# Altium schematic sheet Main Scheme.SchDoc: ИЛ1428ТО1/1
size 410 x 297 mm; ApprovedBy: Стерхов В.Д.; CheckedBy: Стерхов В.Д.; Author: Сергеев Д.А.; CompanyName: ГК "СНАБЖЕНИЕ"; DrawnBy: Сергеев Д.А.; Engineer: Сергеев Д.А.; Organization: ГК "СНАБЖЕНИЕ"; DocumentNumber: ИЛ1428ТО1/1; Revision: 1; SheetNumber: 1; SheetTotal: 5
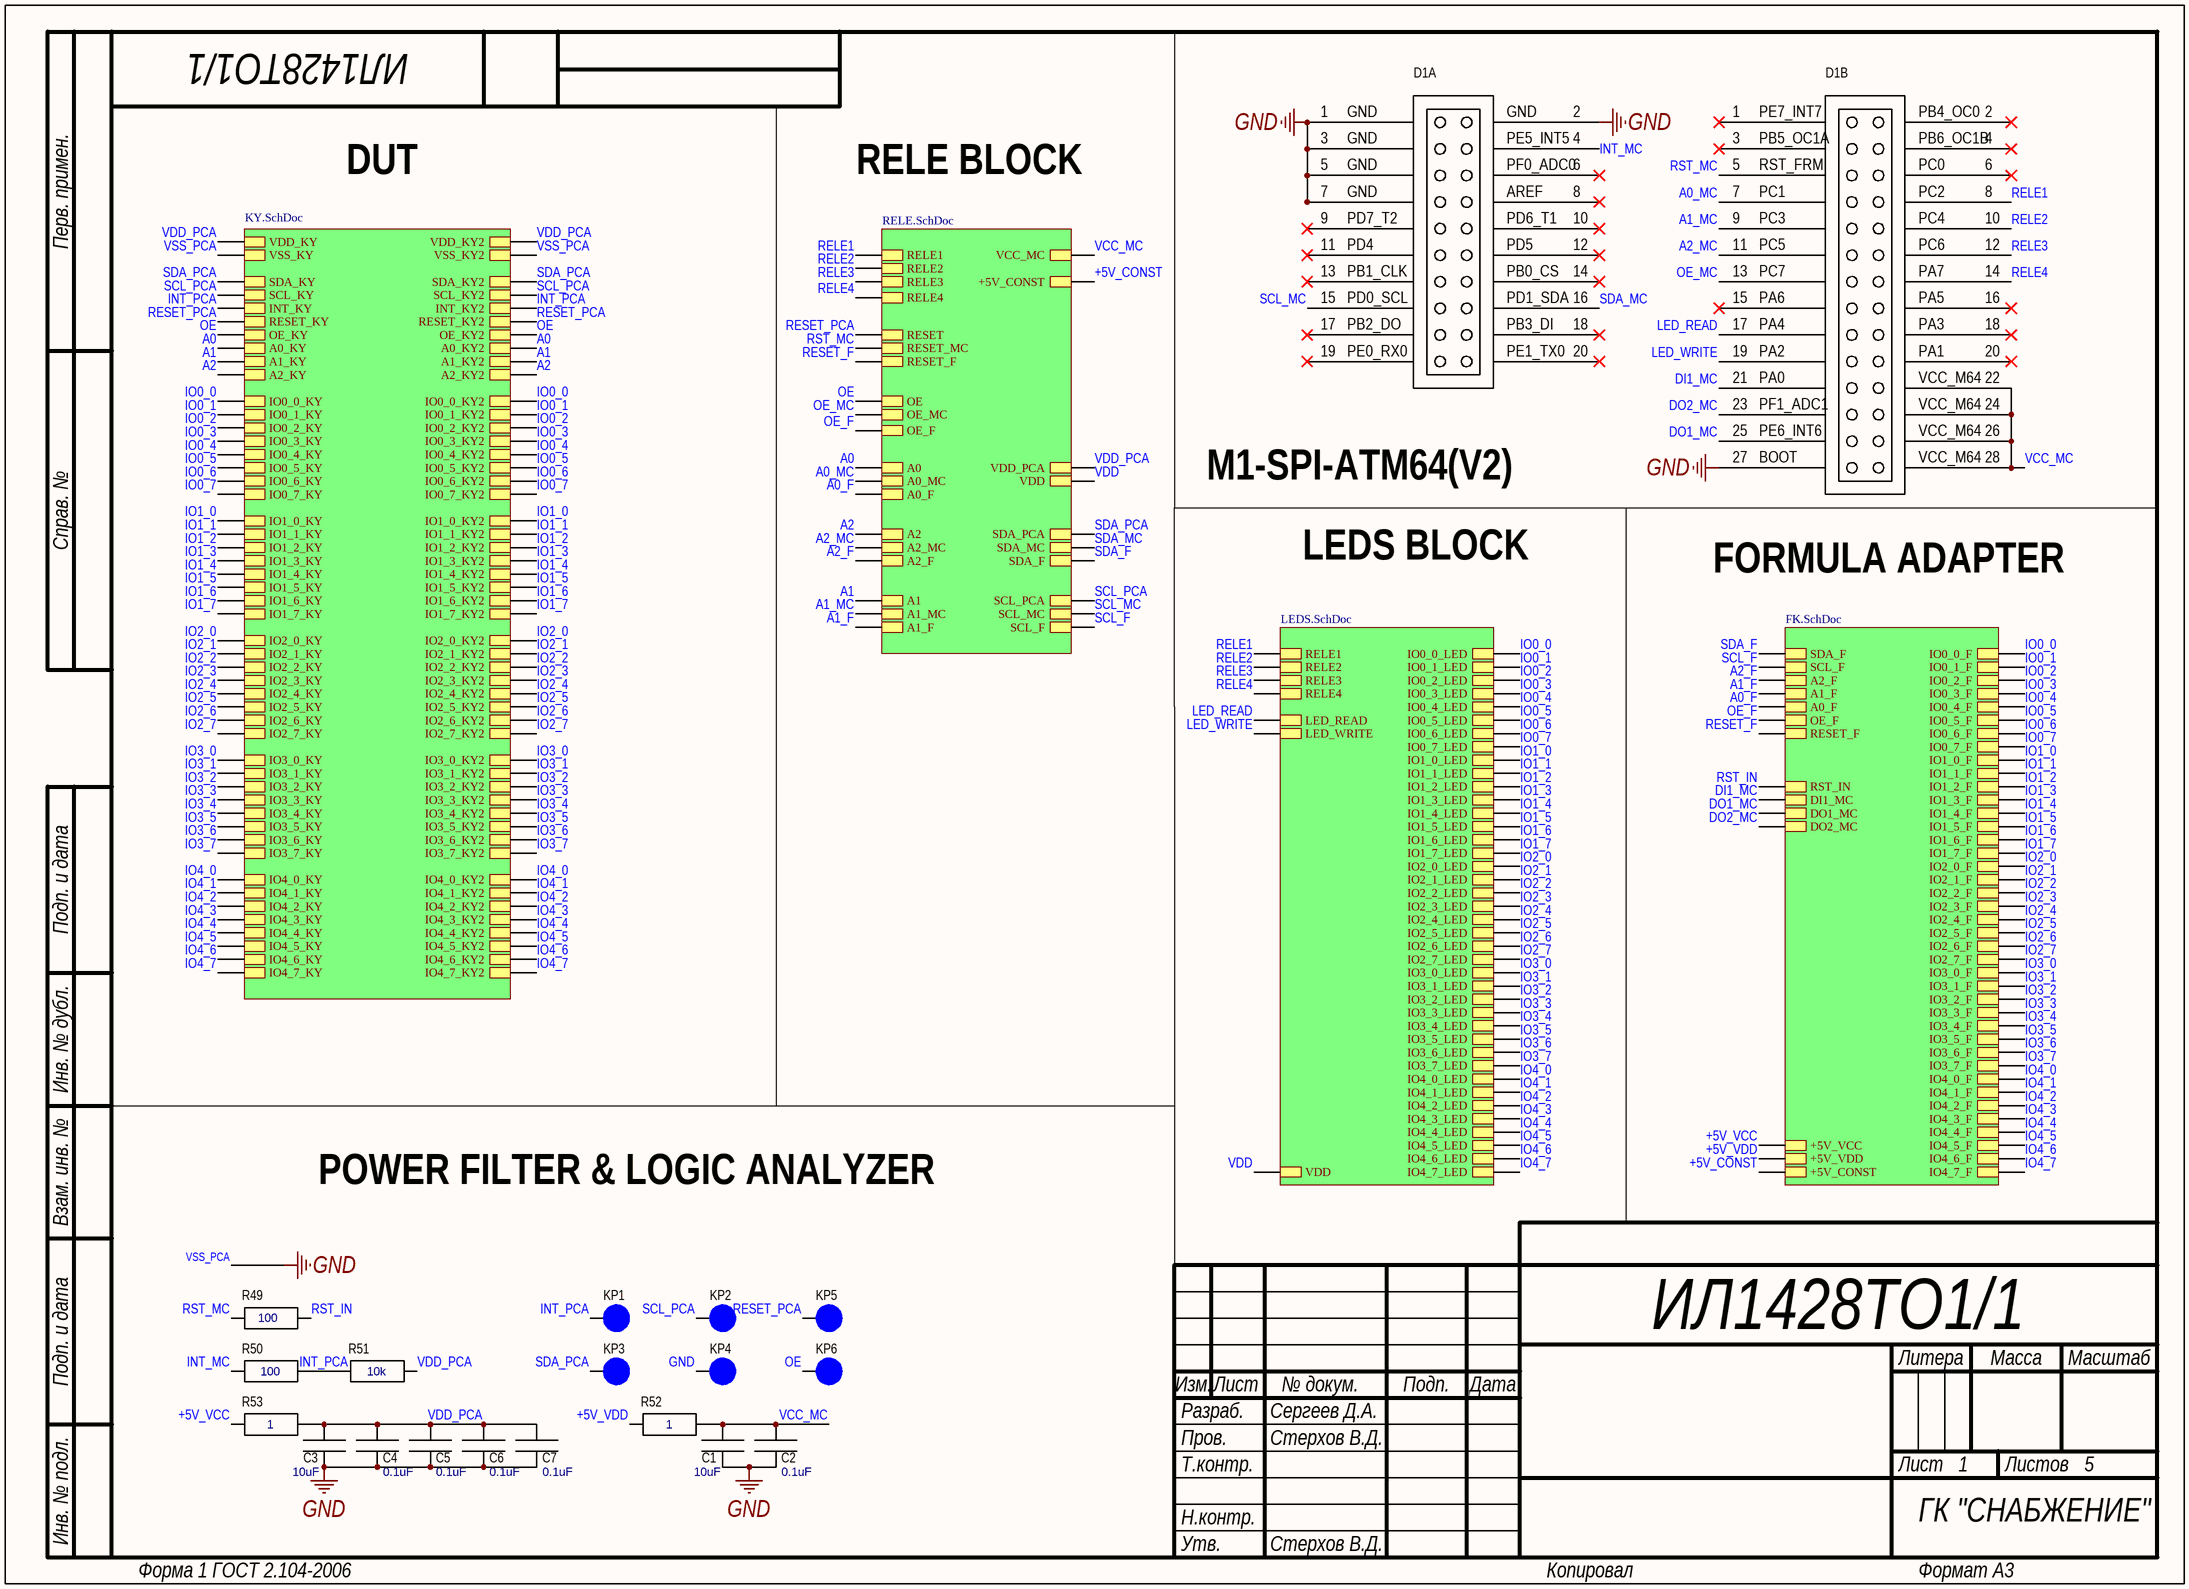
[diagram p0: Main Scheme.SchDoc]

## Parts
C1  10uF  [0805]
C2  0.1uF  [0805]
C3  10uF  [0805]
C4  0.1uF  [0805]
C5  0.1uF  [0805]
C6  0.1uF  [0805]
C7  0.1uF  [0805]
D1  M1-SPI-ATM64(V2)  [M1-SPI-ATM64(V2)]  (value not drawn)  (parts A,B of 2)
KP1  Contact  [Contact]  (value not drawn)
KP2  Contact  [Contact]  (value not drawn)
KP3  Contact  [Contact]  (value not drawn)
KP4  Contact  [Contact]  (value not drawn)
KP5  Contact  [Contact]  (value not drawn)
KP6  Contact  [Contact]  (value not drawn)
R49  100  [0805]
R50  100  [0805]
R51  10k  [0805]
R52  1  [0805]
R53  1  [0805]

## Sub-sheets
FK = FK.SchDoc: +5V_VCC, +5V_VDD, +5V_CONST, RESET_F, OE_F, A0_F, A1_F, A2_F, SDA_F, SCL_F, IO0_0_F, IO0_1_F, IO0_2_F, IO0_3_F, IO0_4_F, IO0_5_F, IO0_6_F, IO0_7_F, IO1_0_F, IO1_1_F, IO1_2_F, IO1_3_F, IO1_4_F, IO1_5_F, IO1_6_F, IO1_7_F, IO2_0_F, IO2_1_F, IO2_2_F, IO2_3_F, IO2_4_F, IO2_5_F, IO2_6_F, IO2_7_F, IO3_0_F, IO3_1_F, IO3_2_F, IO3_3_F, IO3_4_F, IO3_5_F, IO3_6_F, IO3_7_F, IO4_0_F, IO4_1_F, IO4_2_F, IO4_3_F, IO4_4_F, IO4_5_F, IO4_6_F, IO4_7_F, DI1_MC, DO1_MC, DO2_MC, RST_IN
LEDS = LEDS.SchDoc: VDD, IO0_0_LED, IO0_1_LED, IO0_2_LED, IO0_3_LED, IO0_4_LED, IO0_5_LED, IO0_6_LED, IO0_7_LED, IO1_0_LED, IO1_1_LED, IO1_2_LED, IO1_3_LED, IO1_4_LED, IO1_5_LED, IO1_6_LED, IO1_7_LED, IO2_0_LED, IO2_1_LED, IO2_2_LED, IO2_3_LED, IO2_4_LED, IO2_5_LED, IO2_6_LED, IO2_7_LED, IO3_0_LED, IO3_1_LED, IO3_2_LED, IO3_3_LED, IO3_4_LED, IO3_5_LED, IO3_6_LED, IO3_7_LED, IO4_0_LED, IO4_1_LED, IO4_2_LED, IO4_3_LED, IO4_4_LED, IO4_5_LED, IO4_6_LED, IO4_7_LED, RELE1, RELE2, LED_WRITE, LED_READ, RELE3, RELE4
RELE = RELE.SchDoc: +5V_CONST, SCL_PCA, SDA_PCA, SDA_MC, SCL_MC, VCC_MC, RELE1, SDA_F, SCL_F, VDD_PCA, VDD, RESET, RESET_MC, RESET_F, RELE2, A0, A0_MC, A0_F, A1, A1_MC, A1_F, RELE3, A2, A2_MC, A2_F, OE, OE_MC, OE_F, RELE4
UCP_s21 = KY.SchDoc: IO1_1_KY2, IO1_4_KY2, IO4_1_KY2, IO4_7_KY2, VDD_KY, IO4_0_KY2, IO4_4_KY2, IO4_3_KY2, VSS_KY, IO4_5_KY2, IO3_7_KY2, IO3_6_KY2, IO2_1_KY2, SCL_KY2, IO2_6_KY2, IO2_0_KY2, OE_KY2, A2_KY2, VDD_KY2, IO2_2_KY2, IO2_4_KY2, IO1_3_KY2, IO1_2_KY2, IO3_5_KY2, IO2_3_KY2, A0_KY2, IO1_7_KY2, A1_KY2, SDA_KY2, IO3_1_KY2, IO2_5_KY2, IO2_7_KY2, IO3_0_KY2, VSS_KY2, IO1_0_KY2, IO3_3_KY2, RESET_KY2, INT_KY2, IO4_2_KY2, IO4_6_KY2, IO1_6_KY2, IO3_4_KY2, INT_KY, IO1_5_KY2, IO3_2_KY2, IO0_7_KY2, IO0_5_KY2, IO0_6_KY2, SCL_KY, IO0_7_KY, IO1_3_KY, IO0_3_KY2, IO0_4_KY2, IO3_2_KY, RESET_KY, OE_KY, IO1_7_KY, IO0_3_KY, IO2_5_KY, IO3_4_KY, IO1_0_KY, IO0_6_KY, IO0_2_KY, IO2_7_KY, IO2_0_KY, IO3_1_KY, IO4_3_KY, IO0_4_KY, IO0_5_KY, IO3_7_KY, IO3_3_KY, IO3_6_KY, IO1_4_KY, IO1_5_KY, IO4_6_KY, IO4_1_KY, IO0_0_KY2, IO2_2_KY, IO0_1_KY, IO3_0_KY, IO2_1_KY, IO3_5_KY, IO1_1_KY, IO4_4_KY, IO4_2_KY, A0_KY, A1_KY, IO1_2_KY, IO2_3_KY, IO0_2_KY2, A2_KY, IO2_4_KY, IO4_7_KY, IO0_1_KY2, IO1_6_KY, SDA_KY, IO4_5_KY, IO2_6_KY, IO0_0_KY, IO4_0_KY

## Nets
GND: C1.2 C2.2 C3.2 C4.2 C5.2 C6.2 C7.2 D1.1X2 D1.2X2 D1.3X2 D1.5X2 D1.7X2 D1.27X3 KP4.1 ; sheet UCP_s21/VSS_KY, sheet UCP_s21/VSS_KY2  [also labelled VSS_PCA]
+5V_CONST: sheet FK/+5V_CONST, sheet RELE/+5V_CONST
+5V_VCC: R53.1 ; sheet FK/+5V_VCC
+5V_VDD: R52.1 ; sheet FK/+5V_VDD
A0: sheet RELE/A0, sheet UCP_s21/A0_KY2, sheet UCP_s21/A0_KY
A0_F: sheet FK/A0_F, sheet RELE/A0_F
A0_MC: D1.7X3 ; sheet RELE/A0_MC
A1: sheet RELE/A1, sheet UCP_s21/A1_KY2, sheet UCP_s21/A1_KY
A1_F: sheet FK/A1_F, sheet RELE/A1_F
A1_MC: D1.9X3 ; sheet RELE/A1_MC
A2: sheet RELE/A2, sheet UCP_s21/A2_KY2, sheet UCP_s21/A2_KY
A2_F: sheet FK/A2_F, sheet RELE/A2_F
A2_MC: D1.11X3 ; sheet RELE/A2_MC
DI1_MC: D1.21X3 ; sheet FK/DI1_MC
DO1_MC: D1.25X3 ; sheet FK/DO1_MC
DO2_MC: D1.23X3 ; sheet FK/DO2_MC
INT_MC: D1.4X2 R50.1
INT_PCA: KP1.1 R50.2 R51.1 ; sheet UCP_s21/INT_KY2, sheet UCP_s21/INT_KY
IO0_0: sheet LEDS/IO0_0_LED, sheet FK/IO0_0_F, sheet UCP_s21/IO0_0_KY2, sheet UCP_s21/IO0_0_KY
IO0_1: sheet LEDS/IO0_1_LED, sheet FK/IO0_1_F, sheet UCP_s21/IO0_1_KY, sheet UCP_s21/IO0_1_KY2
IO0_2: sheet LEDS/IO0_2_LED, sheet FK/IO0_2_F, sheet UCP_s21/IO0_2_KY, sheet UCP_s21/IO0_2_KY2
IO0_3: sheet LEDS/IO0_3_LED, sheet FK/IO0_3_F, sheet UCP_s21/IO0_3_KY2, sheet UCP_s21/IO0_3_KY
IO0_4: sheet LEDS/IO0_4_LED, sheet FK/IO0_4_F, sheet UCP_s21/IO0_4_KY2, sheet UCP_s21/IO0_4_KY
IO0_5: sheet LEDS/IO0_5_LED, sheet FK/IO0_5_F, sheet UCP_s21/IO0_5_KY2, sheet UCP_s21/IO0_5_KY
IO0_6: sheet LEDS/IO0_6_LED, sheet FK/IO0_6_F, sheet UCP_s21/IO0_6_KY2, sheet UCP_s21/IO0_6_KY
IO0_7: sheet LEDS/IO0_7_LED, sheet FK/IO0_7_F, sheet UCP_s21/IO0_7_KY2, sheet UCP_s21/IO0_7_KY
IO1_0: sheet LEDS/IO1_0_LED, sheet FK/IO1_0_F, sheet UCP_s21/IO1_0_KY2, sheet UCP_s21/IO1_0_KY
IO1_1: sheet LEDS/IO1_1_LED, sheet FK/IO1_1_F, sheet UCP_s21/IO1_1_KY2, sheet UCP_s21/IO1_1_KY
IO1_2: sheet LEDS/IO1_2_LED, sheet FK/IO1_2_F, sheet UCP_s21/IO1_2_KY2, sheet UCP_s21/IO1_2_KY
IO1_3: sheet LEDS/IO1_3_LED, sheet FK/IO1_3_F, sheet UCP_s21/IO1_3_KY2, sheet UCP_s21/IO1_3_KY
IO1_4: sheet LEDS/IO1_4_LED, sheet FK/IO1_4_F, sheet UCP_s21/IO1_4_KY2, sheet UCP_s21/IO1_4_KY
IO1_5: sheet LEDS/IO1_5_LED, sheet FK/IO1_5_F, sheet UCP_s21/IO1_5_KY2, sheet UCP_s21/IO1_5_KY
IO1_6: sheet LEDS/IO1_6_LED, sheet FK/IO1_6_F, sheet UCP_s21/IO1_6_KY2, sheet UCP_s21/IO1_6_KY
IO1_7: sheet LEDS/IO1_7_LED, sheet FK/IO1_7_F, sheet UCP_s21/IO1_7_KY2, sheet UCP_s21/IO1_7_KY
IO2_0: sheet LEDS/IO2_0_LED, sheet FK/IO2_0_F, sheet UCP_s21/IO2_0_KY2, sheet UCP_s21/IO2_0_KY
IO2_1: sheet LEDS/IO2_1_LED, sheet FK/IO2_1_F, sheet UCP_s21/IO2_1_KY2, sheet UCP_s21/IO2_1_KY
IO2_2: sheet LEDS/IO2_2_LED, sheet FK/IO2_2_F, sheet UCP_s21/IO2_2_KY2, sheet UCP_s21/IO2_2_KY
IO2_3: sheet LEDS/IO2_3_LED, sheet FK/IO2_3_F, sheet UCP_s21/IO2_3_KY2, sheet UCP_s21/IO2_3_KY
IO2_4: sheet LEDS/IO2_4_LED, sheet FK/IO2_4_F, sheet UCP_s21/IO2_4_KY2, sheet UCP_s21/IO2_4_KY
IO2_5: sheet LEDS/IO2_5_LED, sheet FK/IO2_5_F, sheet UCP_s21/IO2_5_KY2, sheet UCP_s21/IO2_5_KY
IO2_6: sheet LEDS/IO2_6_LED, sheet FK/IO2_6_F, sheet UCP_s21/IO2_6_KY2, sheet UCP_s21/IO2_6_KY
IO2_7: sheet LEDS/IO2_7_LED, sheet FK/IO2_7_F, sheet UCP_s21/IO2_7_KY2, sheet UCP_s21/IO2_7_KY
IO3_0: sheet LEDS/IO3_0_LED, sheet FK/IO3_0_F, sheet UCP_s21/IO3_0_KY2, sheet UCP_s21/IO3_0_KY
IO3_1: sheet LEDS/IO3_1_LED, sheet FK/IO3_1_F, sheet UCP_s21/IO3_1_KY2, sheet UCP_s21/IO3_1_KY
IO3_2: sheet LEDS/IO3_2_LED, sheet FK/IO3_2_F, sheet UCP_s21/IO3_2_KY2, sheet UCP_s21/IO3_2_KY
IO3_3: sheet LEDS/IO3_3_LED, sheet FK/IO3_3_F, sheet UCP_s21/IO3_3_KY2, sheet UCP_s21/IO3_3_KY
IO3_4: sheet LEDS/IO3_4_LED, sheet FK/IO3_4_F, sheet UCP_s21/IO3_4_KY2, sheet UCP_s21/IO3_4_KY
IO3_5: sheet LEDS/IO3_5_LED, sheet FK/IO3_5_F, sheet UCP_s21/IO3_5_KY2, sheet UCP_s21/IO3_5_KY
IO3_6: sheet LEDS/IO3_6_LED, sheet FK/IO3_6_F, sheet UCP_s21/IO3_6_KY2, sheet UCP_s21/IO3_6_KY
IO3_7: sheet LEDS/IO3_7_LED, sheet FK/IO3_7_F, sheet UCP_s21/IO3_7_KY2, sheet UCP_s21/IO3_7_KY
IO4_0: sheet LEDS/IO4_0_LED, sheet FK/IO4_0_F, sheet UCP_s21/IO4_0_KY2, sheet UCP_s21/IO4_0_KY
IO4_1: sheet LEDS/IO4_1_LED, sheet FK/IO4_1_F, sheet UCP_s21/IO4_1_KY2, sheet UCP_s21/IO4_1_KY
IO4_2: sheet LEDS/IO4_2_LED, sheet FK/IO4_2_F, sheet UCP_s21/IO4_2_KY2, sheet UCP_s21/IO4_2_KY
IO4_3: sheet LEDS/IO4_3_LED, sheet FK/IO4_3_F, sheet UCP_s21/IO4_3_KY2, sheet UCP_s21/IO4_3_KY
IO4_4: sheet LEDS/IO4_4_LED, sheet FK/IO4_4_F, sheet UCP_s21/IO4_4_KY2, sheet UCP_s21/IO4_4_KY
IO4_5: sheet LEDS/IO4_5_LED, sheet FK/IO4_5_F, sheet UCP_s21/IO4_5_KY2, sheet UCP_s21/IO4_5_KY
IO4_6: sheet LEDS/IO4_6_LED, sheet FK/IO4_6_F, sheet UCP_s21/IO4_6_KY2, sheet UCP_s21/IO4_6_KY
IO4_7: sheet LEDS/IO4_7_LED, sheet FK/IO4_7_F, sheet UCP_s21/IO4_7_KY2, sheet UCP_s21/IO4_7_KY
LED_READ: D1.17X3 ; sheet LEDS/LED_READ
LED_WRITE: D1.19X3 ; sheet LEDS/LED_WRITE
OE: KP6.1 ; sheet RELE/OE, sheet UCP_s21/OE_KY2, sheet UCP_s21/OE_KY
OE_F: sheet FK/OE_F, sheet RELE/OE_F
OE_MC: D1.13X3 ; sheet RELE/OE_MC
RELE1: D1.8X3 ; sheet LEDS/RELE1, sheet RELE/RELE1
RELE2: D1.10X3 ; sheet LEDS/RELE2, sheet RELE/RELE2
RELE3: D1.12X3 ; sheet LEDS/RELE3, sheet RELE/RELE3
RELE4: D1.14X3 ; sheet LEDS/RELE4, sheet RELE/RELE4
RESET_F: sheet FK/RESET_F, sheet RELE/RESET_F
RESET_PCA: KP5.1 ; sheet RELE/RESET, sheet UCP_s21/RESET_KY2, sheet UCP_s21/RESET_KY
RST_IN: R49.2 ; sheet FK/RST_IN
RST_MC: D1.5X3 R49.1 ; sheet RELE/RESET_MC
SCL_F: sheet FK/SCL_F, sheet RELE/SCL_F
SCL_MC: D1.15X2 ; sheet RELE/SCL_MC
SCL_PCA: KP2.1 ; sheet RELE/SCL_PCA, sheet UCP_s21/SCL_KY2, sheet UCP_s21/SCL_KY
SDA_F: sheet FK/SDA_F, sheet RELE/SDA_F
SDA_MC: D1.16X2 ; sheet RELE/SDA_MC
SDA_PCA: KP3.1 ; sheet RELE/SDA_PCA, sheet UCP_s21/SDA_KY2, sheet UCP_s21/SDA_KY
VCC_MC: C1.1 C2.1 D1.22X3 D1.24X3 D1.26X3 D1.28X3 R52.2 ; sheet RELE/VCC_MC
VDD: sheet LEDS/VDD, sheet RELE/VDD
VDD_PCA: C3.1 C4.1 C5.1 C6.1 C7.1 R51.2 R53.2 ; sheet RELE/VDD_PCA, sheet UCP_s21/VDD_KY, sheet UCP_s21/VDD_KY2

Not connected (* = marked no-connect by the designer): D1 1X3* 2X3* 3X3* 4X3* 6X2* 6X3* 8X2* 9X2* 10X2* 11X2* 12X2* 13X2* 14X2* 15X3* 16X3* 17X2* 18X2* 18X3* 19X2* 20X2* 20X3*

## Notes on the sheet
- DUT
- RELE BLOCK
- M1-SPI-ATM64(V2)
- LEDS BLOCK
- FORMULA ADAPTER
- POWER FILTER & LOGIC ANALYZER
- Перв. примен.
- Справ. №
- Подп. и дата
- Инв. № дубл.
- Взам. инв. №
- Разраб.
- Изм.
- Лист
- № докум.
- Подп.
- Дата
- Литера
- Масса
- Масштаб
- Пров.
- Т.контр.
- Листов
- Инв. № подл.
- Н.контр.
- Утв.
- Форма 1 ГОСТ 2.104-2006
- Копировал
- Формат А3
- (in symbol M1-SPI-ATM64(V2), part A) GND; 3; PE5_INT5; 4; 5; PF0_ADC0; 6; 7; AREF; 8; 9; PD7_T2; PD6_T1; 10; 11; PD4; PD5; 12; 13; PB1_CLK; PB0_CS; 14; 15; PD0_SCL; PD1_SDA; 16; 17; PB2_DO; PB3_DI; 18; 19; PE0_RX0; PE1_TX0; 20
- (in symbol M1-SPI-ATM64(V2), part B) PE7_INT7; PB4_OC0; 3; PB5_OC1A; PB6_OC1B; 4; 5; RST_FRM; PC0; 6; 7; PC1; PC2; 8; 9; PC3; PC4; 10; 11; PC5; PC6; 12; 13; PC7; PA7; 14; 15; PA6; PA5; 16; 17; PA4; PA3; 18; 19; PA2; PA1; 20; 21; PA0; VCC_M64; 22; 23; PF1_ADC1; 24; 25; PE6_INT6; 26; 27; BOOT; 28

## Library data of the parts
C1-C7 = C0805: ComponentHeigt: 1.3; Firme: AVX; Leadform: SMD; KIND: Конденсатор; ClassName: *; Component Link: *; ComponentWeigt: *; Packaging: 0805; NN: *; Value: *
D1 = M1-SPI-ATM64(V2): ComponentHeigt: 5.5; Name: Вилка; Specification: Вилка PLD2-2 *; Typ: PLD2-2; ClassName: *; Component Link: *; ComponentWeigt: *; Firme: *; Leadform: *; NN: *; KIND: *
R49-R53 = R0805 Yageo: ComponentHeigt: 0.6; Firme: Yageo; Leadform: SMD; Kind: Резистор; ClassName: *; ComponentWeigt: *; Component Link: *; Packaging: 0805; NN: *; Value: *